# Altium schematic sheet reference.SchDoc
size A4
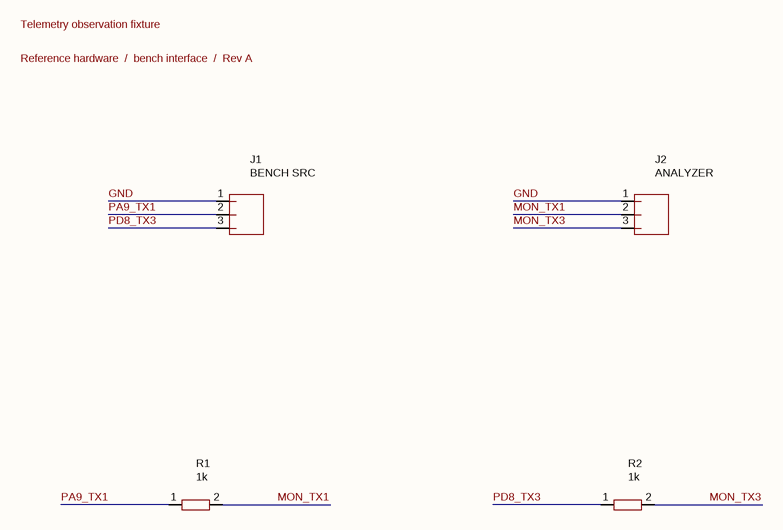
[diagram p0: reference.SchDoc]

## Parts
J1  BENCH SRC  [PinHeader_1x03_P2.54mm_Vertical]
J2  ANALYZER  [PinHeader_1x03_P2.54mm_Vertical]
R1  1k  [R_Axial_DIN0207_L6.3mm_D2.5mm_P7.62mm_Horizontal]
R2  1k  [R_Axial_DIN0207_L6.3mm_D2.5mm_P7.62mm_Horizontal]

## Nets
GND: J1.1(GND) J2.1(GND)
MON_TX1: J2.2(MON_TX1) R1.2(MON_TX1)
MON_TX3: J2.3(MON_TX3) R2.2(MON_TX3)
PA9_TX1: J1.2(PA9_TX1) R1.1(PA9_TX1)
PD8_TX3: J1.3(PD8_TX3) R2.1(PD8_TX3)

## Notes on the sheet
- Telemetry observation fixture
- Reference hardware  /  bench interface  /  Rev A

## Library data of the parts
J1 J2 = Header_3
R1 R2 = Resistor